# Altium schematic sheet Kontrol_Devreleri.SchDoc
size A4; SheetNumber: 6; SheetTotal: 6
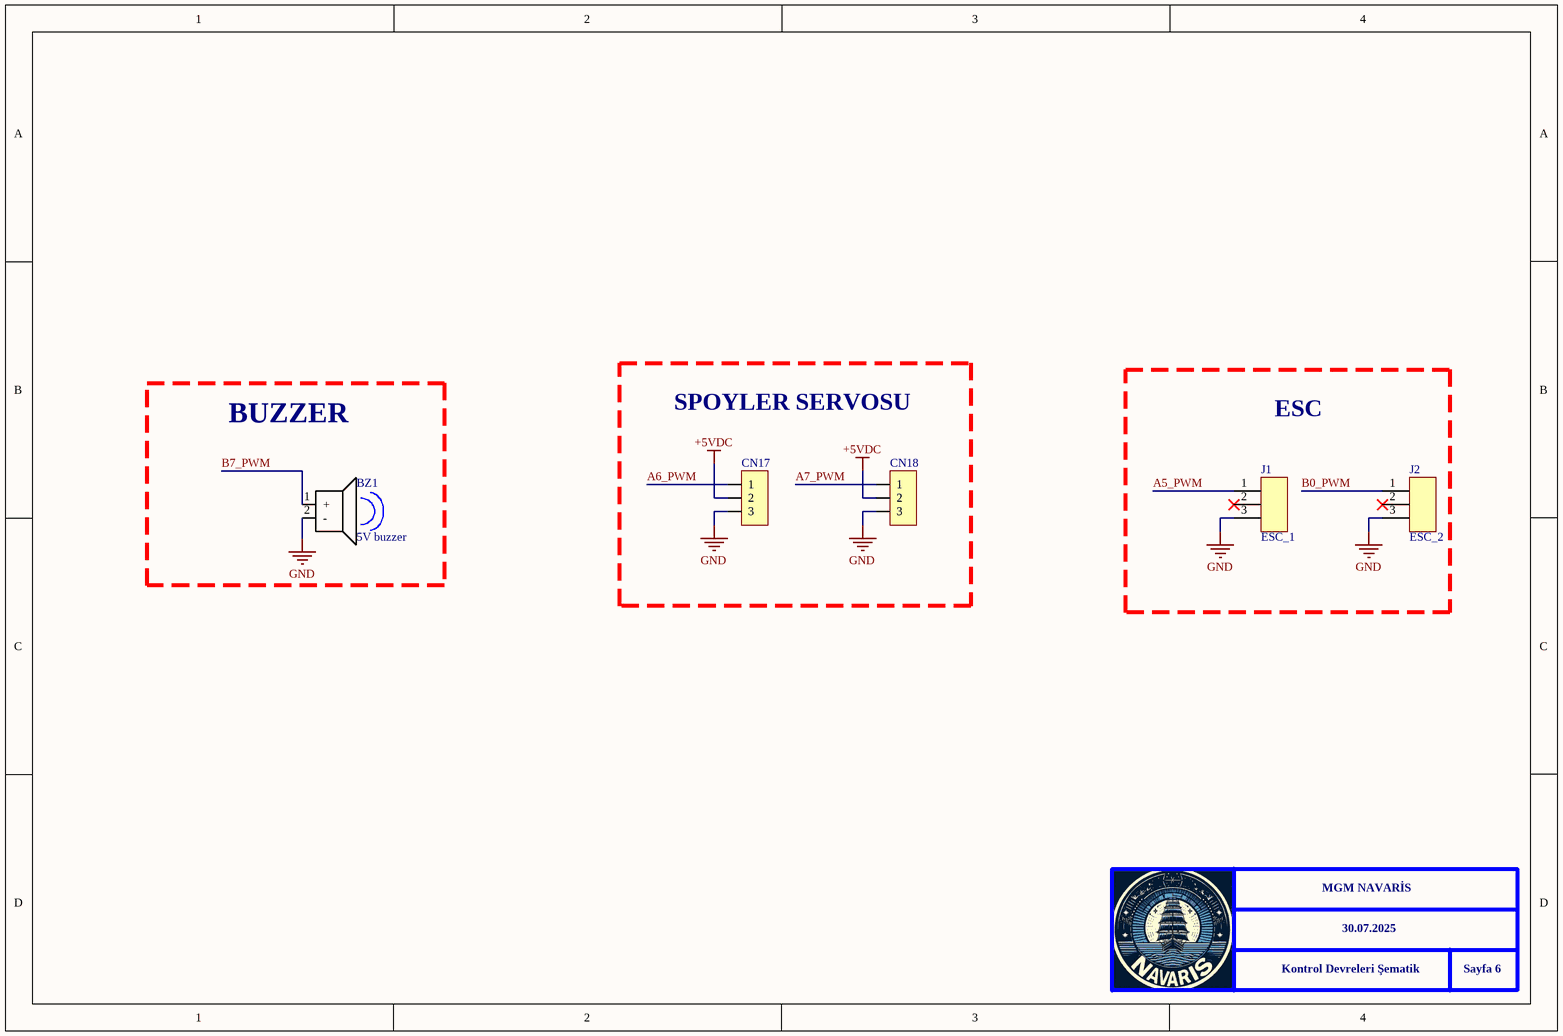
[diagram p0: Kontrol_Devreleri.SchDoc]

## Parts
BZ1  5V buzzer  [5v buzer]
CN17  3_Pin_JST_Male  [3_Pin_JST_Male]  (value not drawn)
CN18  3_Pin_JST_Male  [3_Pin_JST_Male]  (value not drawn)
J1  ESC_1  [HARWIN_M20-9990345]
J2  ESC_2  [HARWIN_M20-9990345]

## Blocks framed on the sheet
SPOYLER SERVOSU: CN17 CN18
ESC: J1 J2

## Nets
+5VDC: CN17.2 CN18.2
GND: BZ1.2(-) CN17.3 CN18.3 J1.3 J2.3
A5_PWM: J1.1
A6_PWM: CN17.1
A7_PWM: CN18.1
B0_PWM: J2.1
B7_PWM: BZ1.1(+)

Not connected (* = marked no-connect by the designer): J1 2*; J2 2*

## Notes on the sheet
- BUZZER
- MGM NAVARİS
- Kontrol Devreleri Şematik
- 30.07.2025
- Sayfa 6

## Library data of the parts
BZ1 = Buzzer
J1 J2 = M20-9990345: 2.54mm (0.1) Pitch SIL Vertical Throughboard Pin Header, 6.1mm mating pin height, gold (hi-temp mould), 3 contacts; MF: Harwin; SnapEDA_Link: https://www.snapeda.com/parts/M20-9990345/Harwin+Inc./view-part/?ref=snap; Package: None; Value: *; MP: M20-9990345; Check_prices: https://www.snapeda.com/parts/M20-9990345/Harwin+Inc./view-part/?ref=eda